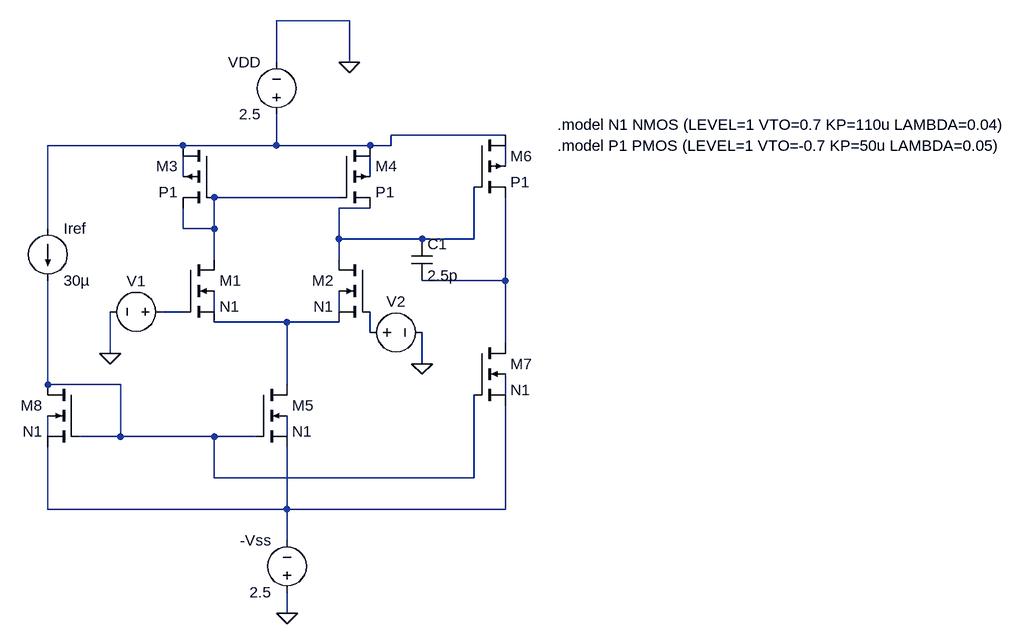
[diagram p0: schematic Two_Stage_OTA.asc]
Two_Stage_OTA.asc, the LTspice schematic file:
Version 4.1
SHEET 1 1540 744
WIRE 352 -208 240 -208
WIRE 240 -144 240 -208
WIRE 352 -144 352 -208
WIRE 592 -32 416 -32
WIRE 96 -16 -112 -16
WIRE 240 -16 240 -64
WIRE 240 -16 96 -16
WIRE 384 -16 240 -16
WIRE 416 -16 416 -32
WIRE 416 -16 384 -16
WIRE 592 16 592 -16
WIRE 96 32 96 0
WIRE 384 32 384 0
WIRE 336 64 144 64
WIRE 384 80 336 80
WIRE -112 112 -112 -16
WIRE 96 112 96 80
WIRE 144 112 144 64
WIRE 144 112 96 112
WIRE 336 128 336 80
WIRE 464 128 336 128
WIRE 544 128 544 48
WIRE 544 128 464 128
WIRE 144 160 144 112
WIRE 336 160 336 128
WIRE 592 192 592 64
WIRE 592 192 464 192
WIRE 96 240 64 240
WIRE 144 240 144 208
WIRE 336 240 336 208
WIRE 256 256 144 256
WIRE 336 256 256 256
WIRE 384 272 384 240
WIRE 592 288 592 192
WIRE -16 304 -16 240
WIRE 464 320 464 272
WIRE -112 352 -112 192
WIRE 0 352 -112 352
WIRE 256 352 256 256
WIRE 592 368 592 336
WIRE -112 432 -112 400
WIRE 0 432 0 352
WIRE 0 432 -64 432
WIRE 144 432 0 432
WIRE 208 432 144 432
WIRE 256 432 256 400
WIRE 144 496 144 432
WIRE 544 496 544 368
WIRE 544 496 144 496
WIRE -112 544 -112 448
WIRE 256 544 256 448
WIRE 256 544 -112 544
WIRE 592 544 592 384
WIRE 592 544 256 544
WIRE 256 592 256 544
WIRE 256 704 256 672
FLAG 352 -144 0
FLAG 256 704 0
FLAG 464 320 0
FLAG -16 304 0
SYMBOL cap 448 128 R0
SYMATTR InstName C1
SYMATTR Value 2.5p
SYMBOL current -112 112 R0
SYMATTR InstName Iref
SYMATTR Value 30µ
SYMBOL voltage 240 -48 R180
WINDOW 0 24 96 Left 2
WINDOW 3 24 16 Left 2
WINDOW 123 0 0 Left 0
WINDOW 39 0 0 Left 0
SYMATTR InstName VDD
SYMATTR Value 2.5
SYMBOL voltage 256 688 R180
WINDOW 0 24 96 Left 2
WINDOW 3 24 16 Left 2
WINDOW 123 0 0 Left 0
WINDOW 39 0 0 Left 0
SYMATTR InstName -Vss
SYMATTR Value 2.5
SYMBOL voltage 80 240 R90
WINDOW 0 -32 56 VBottom 2
WINDOW 3 32 56 Invisible 2
WINDOW 39 0 0 Left 0
SYMATTR InstName V1
SYMATTR Value 0
SYMATTR Value2 AC 0.5 0
SYMBOL voltage 368 272 R270
WINDOW 0 32 56 VTop 2
WINDOW 3 -32 56 Invisible 2
WINDOW 39 0 0 Left 0
SYMATTR InstName V2
SYMATTR Value 0
SYMATTR Value2 AC 0.5 180
SYMBOL nmos4 96 160 R0
SYMATTR InstName M1
SYMATTR Value N1
SYMATTR Value2 l=1u w=1.87u m=1
SYMBOL nmos4 384 160 M0
SYMATTR InstName M2
SYMATTR Value N1
SYMATTR Value2 l=1u w=1.87u m=1
SYMBOL nmos4 208 352 R0
SYMATTR InstName M5
SYMATTR Value N1
SYMATTR Value2 l=1u w=7.59u m=1
SYMBOL nmos4 544 288 R0
SYMATTR InstName M7
SYMATTR Value N1
SYMATTR Value2 l=1u w=33.4u m=1
SYMBOL nmos4 -64 352 M0
SYMATTR InstName M8
SYMATTR Value N1
SYMATTR Value2 l=1u w=7.59u m=1
SYMBOL pmos4 144 -16 M0
SYMATTR InstName M3
SYMATTR Value P1
SYMATTR Value2 l=1u w=15u m=1
SYMBOL pmos4 336 -16 R0
SYMATTR InstName M4
SYMATTR Value P1
SYMATTR Value2 l=1u w=15u m=1
SYMBOL pmos4 544 -32 R0
SYMATTR InstName M6
SYMATTR Value P1
SYMATTR Value2 l=1u w=132u m=1
TEXT 672 -48 Left 2 !.model N1 NMOS (LEVEL=1 VTO=0.7 KP=110u LAMBDA=0.04)
TEXT 672 -16 Left 2 !.model P1 PMOS (LEVEL=1 VTO=-0.7 KP=50u LAMBDA=0.05)

The netlist it stands for:
* Two_Stage_OTA.asc
C1 N006 N007 2.5p
Iref N001 N013 30µ
VDD N001 0 2.5
V§-Vss 0 N017 2.5
V1 N008 0 0 AC 0.5 0
V2 N012 0 0 AC 0.5 180
M1 N005 N008 N011 N009 N1 l=1u w=1.87u m=1
M2 N006 N012 N011 N010 N1 l=1u w=1.87u m=1
M5 N011 N013 N017 N016 N1 l=1u w=7.59u m=1
M7 N007 N013 N017 N014 N1 l=1u w=33.4u m=1
M8 N013 N013 N017 N015 N1 l=1u w=7.59u m=1
M3 N001 N005 N005 N003 P1 l=1u w=15u m=1
M4 N001 N005 N006 N004 P1 l=1u w=15u m=1
M6 N001 N006 N007 N002 P1 l=1u w=132u m=1
.model NMOS NMOS
.model PMOS PMOS
.lib standard.mos
.model N1 NMOS (LEVEL=1 VTO=0.7 KP=110u LAMBDA=0.04)
.model P1 PMOS (LEVEL=1 VTO=-0.7 KP=50u LAMBDA=0.05)
.backanno
.end